# Altium project PSat MCU.PrjPcb
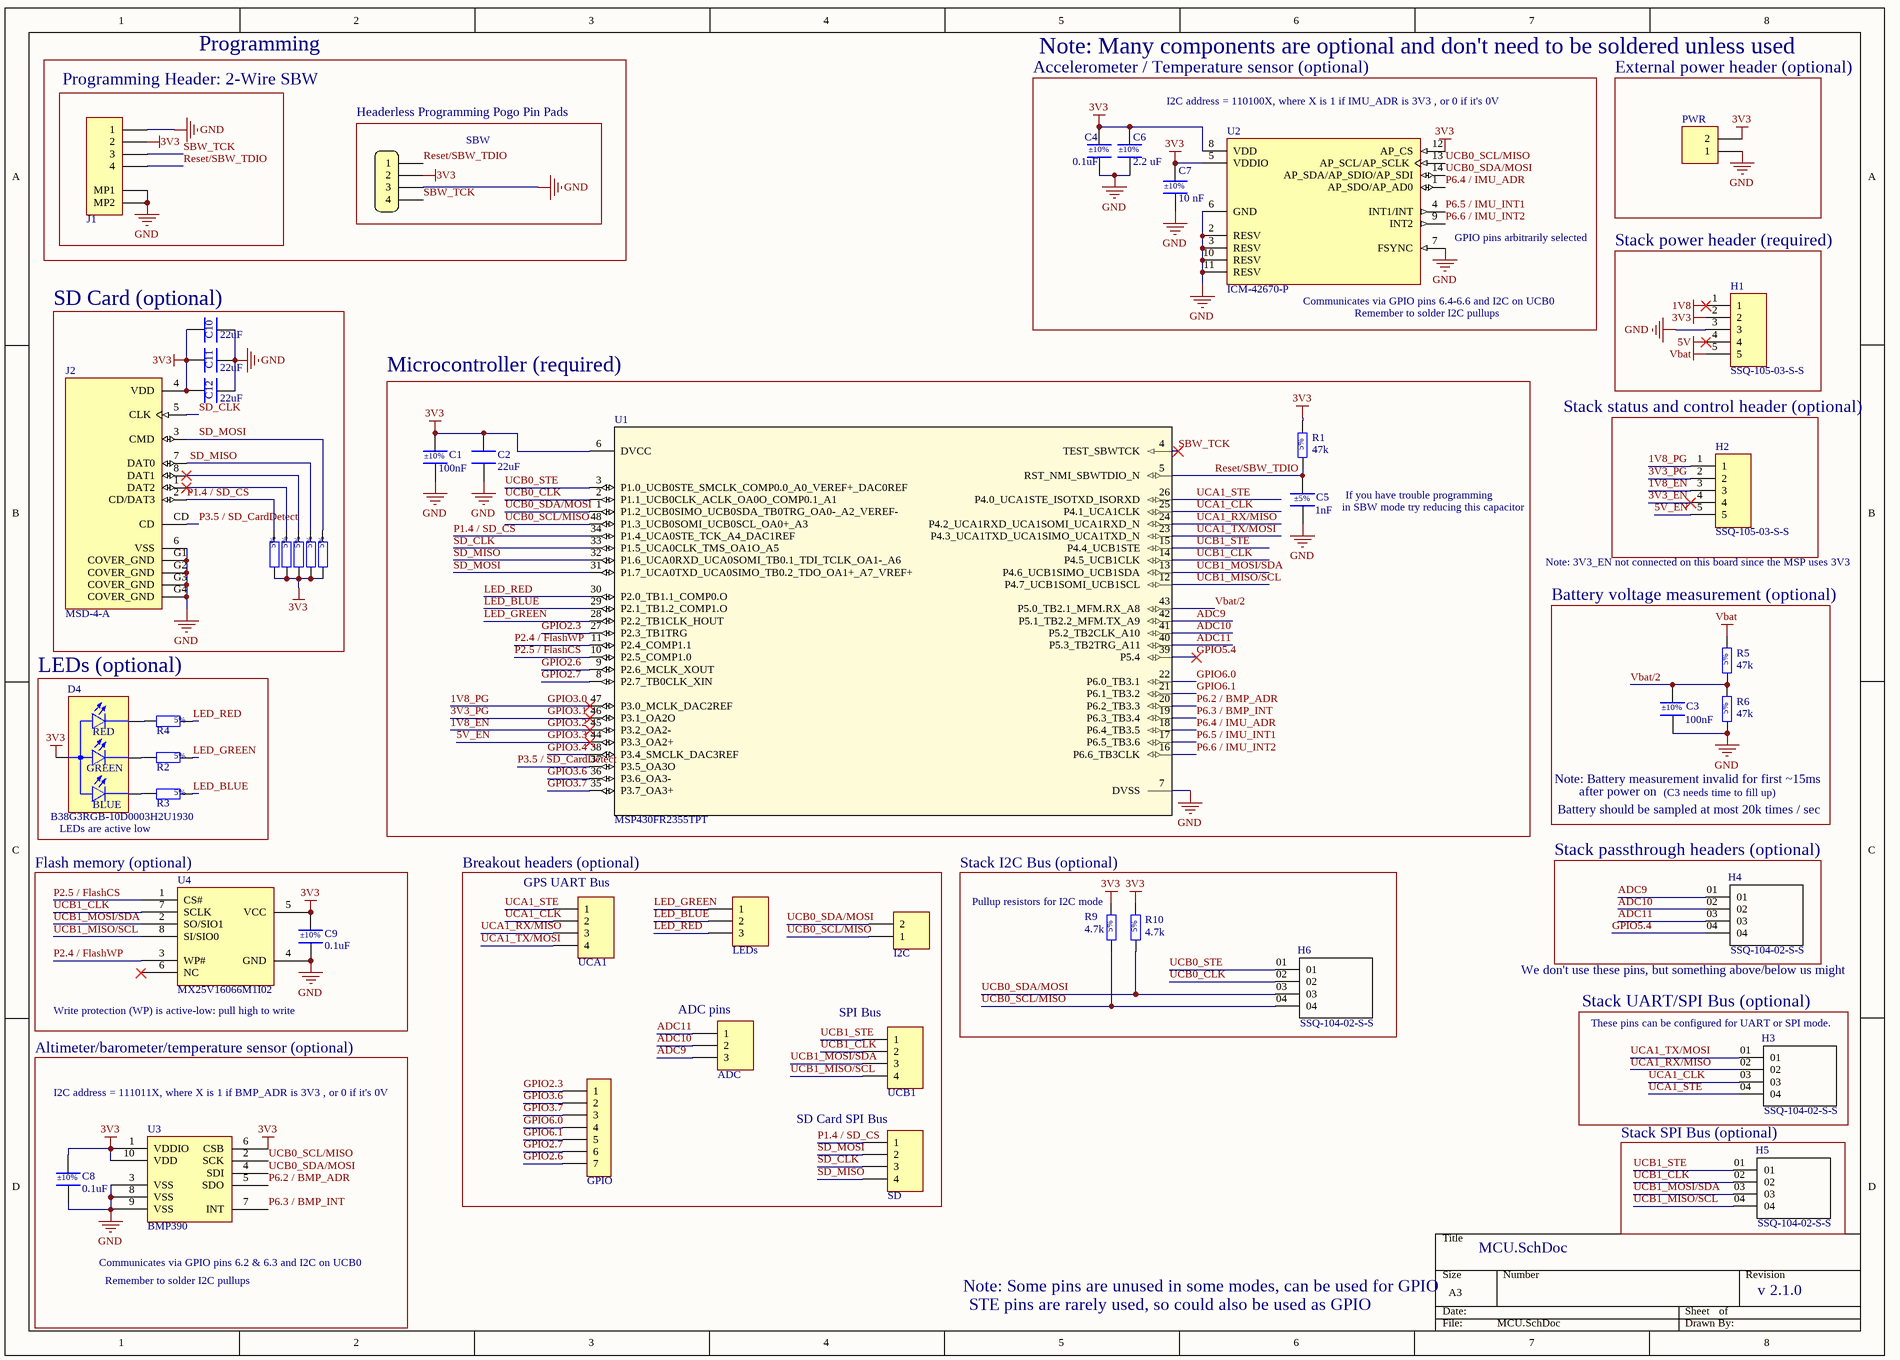
[diagram p0: MCU.SchDoc, left]
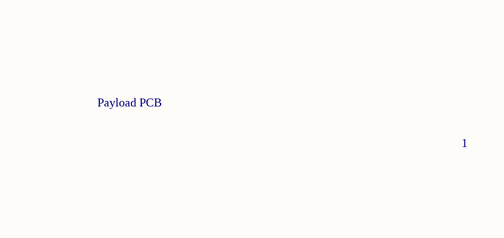
[diagram p1: MCU.SchDoc, right]
version: 2.1.0
1 sheet, 47 parts. Net scope: hierarchical (ports join the sheet entries above them; power ports are global).
Board file: MCU.PcbDoc

## Sheet MCU.SchDoc
size A3

### Parts
ADC  Header 3  [HDR1X3]  (value not drawn)  (no BOM)
C1  100nF  [CAPACITOR_0805_2012M-70N]
C2  22uF  [CAPACITOR_0805_2012M-70N]
C3  100nF  [CAPACITOR_0805_2012M-70N]
C4  0.1uF  [CAPACITOR_0805_2012M-70N]
C5  1nF  [CAPACITOR_0805_2012M-70N]
C6  2.2 uF  [CAPACITOR_0805_2012M-70N]
C7  10 nF  [CAPACITOR_0805_2012M-70N]
C8  0.1uF  [CAPACITOR_0805_2012M-70N]
C9  0.1uF  [CAPACITOR_0805_2012M-70N]
C10  22uF  [CAPACITOR_0805_2012M-70N]
C11  22uF  [CAPACITOR_0805_2012M-70N]
C12  22uF  [CAPACITOR_0805_2012M-70N]
D4  B38G3RGB-10D0003H2U1930  [LED_B38G3RGB-10D0003H2U1930_0606_1616M]
GPIO  HDR,2.54mm,1x7  [HEADER_2.54MM_1x7PIN]  (value not drawn)  (no BOM)
H1  SSQ-105-03-S-S  [SAMTEC_SSQ-105-03-S-S]  (no BOM)
H2  SSQ-105-03-S-S  [SAMTEC_SSQ-105-03-S-S]  (no BOM)
H3  SSQ-104-02-S-S  [*SAMTEC_SSQ-104-02-S-S_SSQ-104-02-S-S(Primary)]  (no BOM)
H4  SSQ-104-02-S-S  [*SAMTEC_SSQ-104-02-S-S_SSQ-104-02-S-S(Primary)]  (no BOM)
H5  SSQ-104-02-S-S  [*SAMTEC_SSQ-104-02-S-S_SSQ-104-02-S-S(Primary)]  (no BOM)
H6  SSQ-104-02-S-S  [*SAMTEC_SSQ-104-02-S-S_SSQ-104-02-S-S(Primary)]  (no BOM)
I2C  (no value)  [HDR1X2]  (no BOM)
J1  5015680407  [MOLEX_5015680407]  (value not drawn)
J2  MSD-4-A  [CUI_MSD-4-A]
LEDs  Header 3  [HDR1X3]  (value not drawn)  (no BOM)
PP2  Headerless Pogo Holes 4-pin  [POGO_4_PIN_HEADER]  (value not drawn)  (no BOM)
PWR  (no value)  [HDR1X2]  (no BOM)
R1  47k  [Resistor_0805_2012M-50N]
R2  4.7k  [Resistor_0805_2012M-50N]  (value not drawn)
R3  4.7k  [Resistor_0805_2012M-50N]  (value not drawn)
R4  4.7k  [Resistor_0805_2012M-50N]  (value not drawn)
R5  47k  [Resistor_0805_2012M-50N]
R6  47k  [Resistor_0805_2012M-50N]
R7  4.7k  [Resistor_0805_2012M-50N]  (value not drawn)
R8  4.7k  [Resistor_0805_2012M-50N]  (value not drawn)
R9  4.7k  [Resistor_0805_2012M-50N]
R10  4.7k  [Resistor_0805_2012M-50N]
R11  4.7k  [Resistor_0805_2012M-50N]  (value not drawn)
R12  4.7k  [Resistor_0805_2012M-50N]  (value not drawn)
R13  4.7k  [Resistor_0805_2012M-50N]  (value not drawn)
SD  Header 4  [HDR1X4]  (value not drawn)  (no BOM)
U1  MSP430FR2355TPT  [PT0048A_L]
U2  ICM-42670-P  [XDCR_ICM-42670-P-EXTENDED_PADS]
U3  BMP390  [BMP390]
U4  MX25V16066M1I02  [SOIC-8 MX25V16066M1I02]
UCA1  Header 4  [HDR1X4]  (value not drawn)  (no BOM)
UCB1  Header 4  [HDR1X4]  (value not drawn)  (no BOM)

### Blocks framed on the sheet
Programming Header: 2-Wire SBW: J1
Accelerometer / Temperature sensor (optional): C4 C6 C7 U2
External power header (optional): PWR
Headerless Programming Pogo Pin Pads: PP2
Stack power header (required): H1
SD Card (optional): C10-C12 J2 R7 R8 R11-R13
Microcontroller (required): C1 C2 C5 R1 U1
Battery voltage measurement (optional): C3 R5 R6
LEDs (optional): D4 R2-R4
Flash memory (optional): C9 U4
Breakout headers (optional): ADC GPIO I2C LEDs SD UCA1 UCB1
Stack I2C Bus (optional): H6 R9 R10
Stack passthrough headers (optional): H4
Stack UART/SPI Bus (optional): H3
Altimeter/barometer/temperature sensor (optional): C8 U3
Stack SPI Bus (optional): H5

### Nets
1V8: H1.1
3V3: C1.2 C2.2 C4.2 C6.2 C7.2 C8.2 C9.2 C10.2 C11.2 C12.2 D4.3(A) H1.2 J1.2 J2.4(VDD) PP2.2 PWR.2 R1.2 R7.2 R8.2 R9.2 R10.2 R11.2 R12.2 R13.2 U1.6(DVCC) U2.5(VDDIO) U2.8(VDD) U2.12(AP_CS) U3.1(VDDIO) U3.6(CSB) U3.10(VDD) U4.5(VCC)
5V: H1.4
GND: C1.1 C2.1 C3.1 C4.1 C5.1 C6.1 C7.1 C8.1 C9.1 C10.1 C11.1 C12.1 H1.3 J1.1 J1.MP1 J1.MP2 J2.6(VSS) J2.G1(COVER_GND) J2.G2(COVER_GND) J2.G3(COVER_GND) J2.G4(COVER_GND) PP2.3 PWR.1 R6.1 U1.7(DVSS) U2.2(RESV) U2.3(RESV) U2.6(GND) U2.7(FSYNC) U2.10(RESV) U2.11(RESV) U3.3(VSS) U3.8(VSS) U3.9(VSS) U4.4(GND)
Vbat: H1.5 R5.2
1V8_EN: H2.3 U1.45(P3.2_OA2-)  [also labelled GPIO3.2]
1V8_PG: H2.1 U1.47(P3.0_MCLK_DAC2REF)  [also labelled GPIO3.0]
3V3_EN: H2.4
3V3_PG: H2.2 U1.46(P3.1_OA2O)  [also labelled GPIO3.1]
5V_EN: H2.5 U1.44(P3.3_OA2+)  [also labelled GPIO3.3]
ADC9: ADC.3 H4.01 U1.42(P5.1_TB2.2_MFM.TX_A9)
ADC10: ADC.2 H4.02 U1.41(P5.2_TB2CLK_A10)
ADC11: ADC.1 H4.03 U1.40(P5.3_TB2TRG_A11)
GPIO2.3: GPIO.1 U1.27(P2.3_TB1TRG)
GPIO2.6: GPIO.7 U1.9(P2.6_MCLK_XOUT)
GPIO2.7: GPIO.6 U1.8(P2.7_TB0CLK_XIN)
GPIO3.4: U1.38(P3.4_SMCLK_DAC3REF)
GPIO3.6: GPIO.2 U1.36(P3.6_OA3-)
GPIO3.7: GPIO.3 U1.35(P3.7_OA3+)
GPIO5.4: H4.04 U1.39(P5.4)
GPIO6.0: GPIO.4 U1.22(P6.0_TB3.1)
GPIO6.1: GPIO.5 U1.21(P6.1_TB3.2)
LED_BLUE: LEDs.2 R3.1 U1.29(P2.1_TB1.2_COMP1.O)
LED_GREEN: LEDs.1 R2.1 U1.28(P2.2_TB1CLK_HOUT)
LED_RED: LEDs.3 R4.1 U1.30(P2.0_TB1.1_COMP0.O)
P1.4 / SD_CS: J2.2(CD/DAT3) R7.1 SD.1 U1.34(P1.4_UCA0STE_TCK_A4_DAC1REF)
P2.4 / FlashWP: U1.11(P2.4_COMP1.1) U4.3(WP#)
P2.5 / FlashCS: U1.10(P2.5_COMP1.0) U4.1(CS#)
P3.5 / SD_CardDetect: J2.CD U1.37(P3.5_OA3O)
P6.2 / BMP_ADR: U1.20(P6.2_TB3.3) U3.5(SDO)
P6.3 / BMP_INT: U1.19(P6.3_TB3.4) U3.7(INT)
P6.4 / IMU_ADR: U1.18(P6.4_TB3.5) U2.1(AP_SDO/AP_AD0)
P6.5 / IMU_INT1: U1.17(P6.5_TB3.6) U2.4(INT1/INT)
P6.6 / IMU_INT2: U1.16(P6.6_TB3CLK) U2.9(INT2)
Reset/SBW_TDIO: C5.2 J1.4 PP2.1 R1.1 U1.5(RST_NMI_SBWTDIO_N)
SBW_TCK: J1.3 PP2.4 U1.4(TEST_SBWTCK)
SD_CLK: J2.5(CLK) SD.3 U1.33(P1.5_UCA0CLK_TMS_OA1O_A5)
SD_MISO: J2.7(DAT0) R12.1 SD.4 U1.32(P1.6_UCA0RXD_UCA0SOMI_TB0.1_TDI_TCLK_OA1-_A6)
SD_MOSI: J2.3(CMD) R13.1 SD.2 U1.31(P1.7_UCA0TXD_UCA0SIMO_TB0.2_TDO_OA1+_A7_VREF+)
UCA1_CLK: H3.03 U1.25(P4.1_UCA1CLK) UCA1.2
UCA1_RX/MISO: H3.02 U1.24(P4.2_UCA1RXD_UCA1SOMI_UCA1RXD_N) UCA1.3
UCA1_STE: H3.04 U1.26(P4.0_UCA1STE_ISOTXD_ISORXD) UCA1.1
UCA1_TX/MOSI: H3.01 U1.23(P4.3_UCA1TXD_UCA1SIMO_UCA1TXD_N) UCA1.4
UCB0_CLK: H6.02 U1.2(P1.1_UCB0CLK_ACLK_OA0O_COMP0.1_A1)
UCB0_SCL/MISO: H6.04 I2C.1 R9.1 U1.48(P1.3_UCB0SOMI_UCB0SCL_OA0+_A3) U2.13(AP_SCL/AP_SCLK) U3.2(SCK)
UCB0_SDA/MOSI: H6.03 I2C.2 R10.1 U1.1(P1.2_UCB0SIMO_UCB0SDA_TB0TRG_OA0-_A2_VEREF-) U2.14(AP_SDA/AP_SDIO/AP_SDI) U3.4(SDI)
UCB0_STE: H6.01 U1.3(P1.0_UCB0STE_SMCLK_COMP0.0_A0_VEREF+_DAC0REF)
UCB1_CLK: H5.02 U1.14(P4.5_UCB1CLK) U4.7(SCLK) UCB1.2
UCB1_MISO/SCL: H5.04 U1.12(P4.7_UCB1SOMI_UCB1SCL) U4.8(SI/SIO0) UCB1.4
UCB1_MOSI/SDA: H5.03 U1.13(P4.6_UCB1SIMO_UCB1SDA) U4.2(SO/SIO1) UCB1.3
UCB1_STE: H5.01 U1.15(P4.4_UCB1STE) UCB1.1
Vbat/2: C3.2 R5.1 R6.2 U1.43(P5.0_TB2.1_MFM.RX_A8)
NetD4_1: D4.1(G_C) R2.2
NetD4_2: D4.2(B_C) R3.2
NetD4_4: D4.4(R_C) R4.2
NetJ2_1: J2.1(DAT2) R8.1
NetJ2_8: J2.8(DAT1) R11.1

Not connected (* = marked no-connect by the designer): U4 6(NC)*

### Notes on the sheet
- Programming
- Note: Many components are optional and don't need to be soldered unless used
- I2C address = 110100X, where X is 1 if IMU_ADR is 3V3 , or 0 if it's 0V
- SBW
- (near U2) GPIO pins arbitrarily selected
- (near U2) Communicates via GPIO pins 6.4-6.6 and I2C on UCB0
- (near U2) Remember to solder I2C pullups
- Stack status and control header (optional)
- in SBW mode try reducing this capacitor
- If you have trouble programming
- (near H2) Note: 3V3_EN not connected on this board since the MSP uses 3V3
- LEDs are active low
- Note: Battery measurement invalid for first ~15ms
- Battery should be sampled at most 20k times / sec
- after power on
- (C3 needs time to fill up)
- (near UCA1) GPS UART Bus
- Pullup resistors for I2C mode
- (near U4) Write protection (WP) is active-low: pull high to write
- (near ADC) ADC pins
- (near UCB1) SPI Bus
- (near H4) We don't use these pins, but something above/below us might
- (near H3) These pins can be configured for UART or SPI mode.
- I2C address = 111011X, where X is 1 if BMP_ADR is 3V3 , or 0 if it's 0V
- (near SD) SD Card SPI Bus
- Payload PCB
- Communicates via GPIO pins 6.2 & 6.3 and I2C on UCB0
- Remember to solder I2C pullups
- Note: Some pins are unused in some modes, can be used for GPIO
- STE pins are rarely used, so could also be used as GPIO
- v
- 1
- (in symbol B38G3RGB-10D0003H2U1930) RED; GREEN; BLUE

### Library data of the parts
ADC LEDs = Header 3: Header, 3-Pin
C1 C3 C4 C6-C9 = Generic Capacitor: MF Part No.: C0805C104K5RAC7800; Tolerance: ±10%; Temperature Coefficient: X7R; Rated Voltage: 50V; Capacitance at Rated Voltage: 40%; Temp Range: -55°C ~ 125°C; Supplier 1: Digikey; Supplier 1 Part No.: 399-C0805C104K5RAC7800CT-ND; Package: 0805
  C1 C3: Value: 100nF
  C4 C8 C9: Value: 0.1uF
  C6: Value: 2.2 uF
  C7: Value: 10 nF
C2 = C0805C226M9PACTU: Passive - Capacitor, X5R, 22uF Max, 6.3V, 0805 (2012 Metric), ±20%, -55°C ~ 85°C. 8.8uF @ 5V; APSS Standard Part: APSS Standard; Capacitance at Rated Voltage: 30%; Tolerance: ±20%; Temperature Coefficient: X5R; Rated Voltage: 6.3V; Temp Range: -55°C ~ 85°C; Package: 0402; Supplier 1: Digikey; Supplier 1 Part No.: 399-C0805C226M9PAC7800CT-ND; MF Part No.: C0805C226M9PACTU; Value: 22uF
C5 = Generic Capacitor: MF Part No.: 399-C0805C102J5GAC7800CT-ND; Tolerance: ±5%; Temperature Coefficient: X7R; Rated Voltage: 50V; Capacitance at Rated Voltage: 100%; Temp Range: -55°C ~ 125°C; Supplier 1: Digikey; Supplier 1 Part No.: 399-C0805C102J5GAC7800CT-ND; Package: 0805; Value: 1nF
C10-C12 = GRM21BR61C226ME44L: Passive - Capacitor, X5R, 22uF Max, 16V, 0805 (2012 Metric), ±20%, -55°C ~ 85°C. 9.4uF @ 5V, 3.2uF @ 15V, 1.9uF @ 25V; APSS Standard Part: APSS Standard; Capacitance at Rated Voltage: 10%; Tolerance: ±20%; Temperature Coefficient: X5R; Rated Voltage: 16V; Temp Range: -55°C ~ 85°C; Package: 0805; Supplier 1: Digikey; Supplier 1 Part No.: 490-10747-1-ND; MF Part No.: GRM21BR61C226ME44L; Value: 22uF
D4 = B38G3RGB-10D0003H2U1930: Diode - LED, RGB, 2V Red, 3V Green, 3V Blue 0606 (1616 Metric); APSS Standard Part: APSS Standard; Temp Range: -40°C ~ 85°C; MF Part No.: B38G3RGB-10D0003H2U1930; Package: 0606; Supplier 1: Digikey; Supplier 1 Part No.: 3147-B38G3RGB-10D0003H2U1930CT-ND
GPIO = HDR,2.54mm,1x7: Connector - 2.54mm, 1x7-pin
I2C PWR = Header 2: Header, 2-Pin
J1 = 5015680407: Connector - Picoclasp  04-pin, SMT, RA; APSS Standard Part: APSS Standard; Pitch: 1mm; Mounting Type: Surface Mount; Orientation: Straight; MF Part No.: 5015680407; Pins: 4; Supplier 1: Digikey; Supplier 1 Part No.: WM7895CT-ND
J2 = MSD-4-A: Micro SD Card Connector, 9 Positions, Connector and Ejector, Push In, Auto Eject Out, Surface Mount, 1.8 mm Height Above Board, Gold Flash; MF: Same Sky; SnapEDA_Link: https://www.snapeda.com/parts/MSD-4-A/Same+Sky/view-part/?ref=snap; Package: None; Value: *; MP: MSD-4-A; Check_prices: https://www.snapeda.com/parts/MSD-4-A/Same+Sky/view-part/?ref=eda
R1 R6 = RMCF0805JT Series: Passive - Resistor Series, 0805, 5%, 100m - 22M, E24, 0.063W, 1/16W, ±200ppm/°C, -55°C ~ 155°C, 0805 (2012 Metric); MF Part No.: RMCF0805JT47K0; APSS Standard Part: APSS Standard; Power: 1/8W; Value Range: 100m ~ 22M; Rated Voltage: 150V; Tolerance: 5%; E Series: E24; Temp Range: -55°C ~ 155°C; Supplier 1: Digikey; Package: 0805; Temperature Coefficient: ±200ppm/°C; Value: 47k
R2-R4 R7 R8 R11-R13 = RMCF0805JT Series: Passive - Resistor Series, 0805, 5%, 100m - 22M, E24, 0.063W, 1/16W, ±200ppm/°C, -55°C ~ 155°C, 0805 (2012 Metric); MF Part No.: RMCF0805JT1K00; APSS Standard Part: APSS Standard; Power: 1/8W; Value Range: 100m ~ 22M; Rated Voltage: 150V; Tolerance: 5%; E Series: E24; Temp Range: -55°C ~ 155°C; Supplier 1: Digikey; Package: 0805; Temperature Coefficient: ±200ppm/°C; Value: 4.7k
R5 = RMCF0805JT Series: Passive - Resistor Series, 0805, 5%, 100m - 22M, E24, 0.063W, 1/16W, ±200ppm/°C, -55°C ~ 155°C, 0805 (2012 Metric); MF Part No.: RMCF0805JT147K0; APSS Standard Part: APSS Standard; Power: 1/8W; Value Range: 100m ~ 22M; Rated Voltage: 150V; Tolerance: 5%; E Series: E24; Temp Range: -55°C ~ 155°C; Supplier 1: Digikey; Package: 0805; Temperature Coefficient: ±200ppm/°C; Value: 47k
R9 R10 = RMCF0805JT Series: Passive - Resistor Series, 0805, 5%, 100m - 22M, E24, 0.063W, 1/16W, ±200ppm/°C, -55°C ~ 155°C, 0805 (2012 Metric); MF Part No.: RMCF0805JT4K70; APSS Standard Part: APSS Standard; Power: 1/8W; Value Range: 100m ~ 22M; Rated Voltage: 150V; Tolerance: 5%; E Series: E24; Temp Range: -55°C ~ 155°C; Supplier 1: Digikey; Package: 0805; Temperature Coefficient: ±200ppm/°C; Value: 4.7k
SD UCA1 UCB1 = Header 4: Header, 4-Pin
U1 = MSP430FR2355IPT: APSS Standard Part: APSS Standard; Rated Voltage: 1.8V ~ 3.6V; Temp Range: -40°C ~ 105°C (TA); MF Part No.: MSP430FR2355TPT; Package: LQFP-48; Supplier 1: Digikey; Supplier 1 Part No.: 296-50260-ND
U2 = ICM-42670-P: IC - Inertial Management Unit: Accelerometer + Gyro + Temperature Sensor, 6 Axis, I2C / I3C / SPI Interfaces; APSS Standard Part: APSS Standard; Rated Voltage: 3.6V; Temp Range: -40°C ~ 85°C; Package: 14-LGA; MF Part No.: ICM-42670-P; Supplier 1: Digikey; Supplier 1 Part No.: 1428-ICM-42670-PCT-ND
U3 = BMP390: Digital Pressure Sensor; APSS Standard Part: APSS Standard; Temp Range: -40°C ~ 85°C; Pressure Range: 30 kPa ~ 125 kPa; Package: LGA; Pins: 10; Supplier 1: Digikey; Supplier 1 Part No.: 828-BMP390CT-ND; Supplier 2: *; Supplier 2 Part No.: *; MF Part No.: BMP390
U4 = MX25V16066M1I02: Flash Memory, SPI, 80 MHz @ 1 I/O and 160 MHz equivalent @ 1I/2O; APSS Standard Part: APSS Standard; Temp Range: -40°C ~ 85°C; Rated Voltage: 3.6V; MF Part No.: MX25V16066M1I02; Package: 150mil 8-SOP; Pins: 8; Supplier 1: Digikey; Supplier 1 Part No.: 1092-MX25V16066M1I02-ND; Supplier 2: *; Supplier 2 Part No.: *
H1 H2 = SSQ-105-03-S-S: MP: SSQ-105-03-S-S